# Altium schematic sheet 6.imu.SchDoc
size A4; DocumentNumber: 7; SheetNumber: 7; SheetTotal: 8; Page: IMU
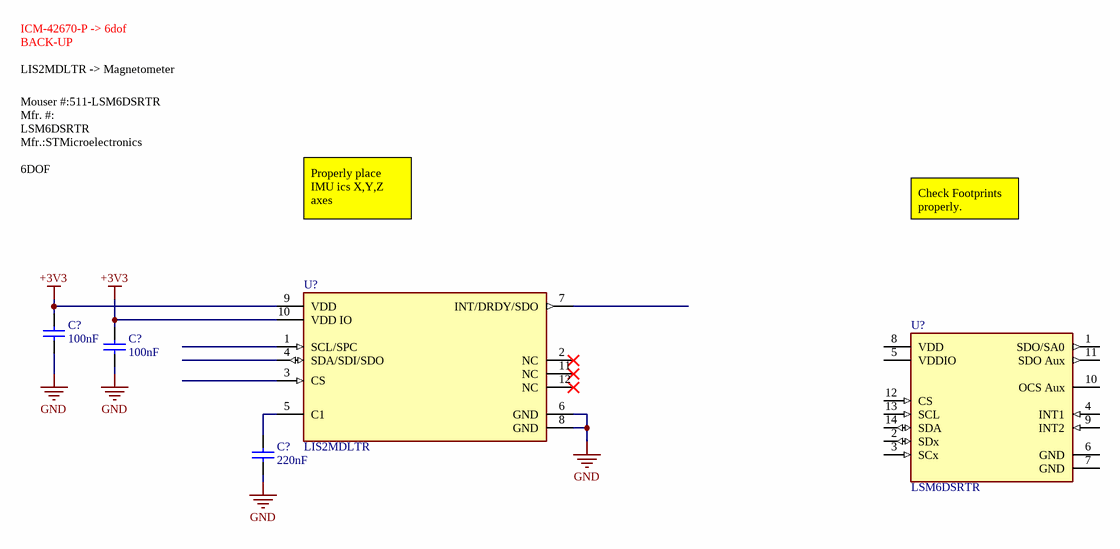
[diagram p0: 6.imu.SchDoc]

## Parts
(Parts that share a designator on the sheet are numbered #1, #2 ... from top to bottom, then left to right.)
C?#1  100nF  [cap0603]
C?#2  100nF  [cap0603]
C?#3  220nF  [cap0603]
U?#1  LIS2MDLTR  [FP-LGA-12-DM00170568-MFG]
U?#2  LSM6DSRTR  [FP-LGA-14L-DM00249496-MFG]

## Nets
+3V3: C?#1.2 C?#2.2 U?#1.9(VDD) U?#1.10(VDD_IO)
GND: C?#1.1 C?#2.1 C?#3.1 U?#1.6(GND) U?#1.8(GND)
NetC?#3_2: C?#3.2 U?#1.5(C1)

Not connected (* = marked no-connect by the designer): U?#1 1(SCL/SPC) 2(NC)* 3(CS) 4(SDA/SDI/SDO) 7(INT/DRDY/SDO) 11(NC)* 12(NC)*; U?#2 1(SDO/SA0) 2(SDx) 3(SCx) 4(INT1) 5(VDDIO) 6(GND) 7(GND) 8(VDD) 9(INT2) 10(OCS_Aux) 11(SDO_Aux) 12(CS) 13(SCL) 14(SDA)

## Notes on the sheet
- LIS2MDLTR -> Magnetometer
- ICM-42670-P -> 6dof
  BACK-UP
- Mouser #:511-LSM6DSRTR
  Mfr. #:
  LSM6DSRTR
  Mfr.:STMicroelectronics
  6DOF
- Properly place IMU ics X,Y,Z axes
- Check Footprints
  properly.
- Title :
- Size:
- Date:
- Page :
- A4
- Number:
- Time:
- Revision:
- Sheet
- of
- Sheet Name :
- Drawn By :

## Library data of the parts
C?#1-C?#3 = Cap: Capacitor; Voltage Rating: 16V; MF: *; MP: *; JLCPCB: *
U?#1 = LIS2MDLTR: SENSOR MR I2C/SPI 12LGA; Manufacturer: STMicroelectronics; Sensing Method: Magnetic; Min Supply Voltage: 1.71V; Sensor Output: I2C,SPI; Operating Supply Current: 50-200uA; Max Supply Voltage: 3.6V; Octopart: https://octopart.com/lis2mdltr-stmicroelectronics-81117311; RoHS: TRUE; Device Class L3: unset; Device Class L1: Sensors; ComponentLink2URL: https://www.st.com/resource/en/datasheet/lis2mdl.pdf; Automotive: No; Device Class L2: Magnetic Sensors; Lead Free: Yes; Temperature: -40°C to +85°C; Manufacturer Part Number: LIS2MDLTR; Temperature Range High: +85°C; Height: 0.7mm; Digikey Description: SENSOR MR I2C/SPI 12LGA; Category: IC; ComponentLink2Description: Datasheet; Package: LGA-12-DM00170568; Temperature Range Low: -40°C
U?#2 = LSM6DSRTR: INEMO INERTIAL MODULE: 3D ACCELE; Manufacturer: STMicroelectronics; Sensor Output: I2C,SPI; Accel Range: 2/4/8/16g; Gyro Range: 125/250/500/1000/2000/4000°/s; Operating Supply Current: 360-1200uA; Max Supply Voltage: 3.6V; Min Supply Voltage: 1.62V; Sensor Type: Temperature,Accelerometer,Gyroscope; Device Class L3: Inertial Measurement Units (IMUs); Package: LGA-14L-DM00249496; ComponentLink2Description: Datasheet; Mouser Description: In a Pack of 2, LSM6DSRTR STMicroelectronics, 3-Axis Accelerometer, Gyroscope, 14-Pin LGA; Footprint Url: https://www.st.com/content/ccc/resource/technical/document/technical_note/73/17/9c/16/dd/96/4a/01/CD00134799.pdf/files/CD00134799.pdf/jcr:content/translations/en.CD00134799.pdf; RoHS: TRUE; Automotive: No; Temperature Range High: +85°C; Digikey Description: INEMO INERTIAL MODULE: 3D ACCELE; Manufacturer Part Number: LSM6DSRTR; ComponentLink2URL: https://www.st.com/resource/en/datasheet/lsm6dsr.pdf; Lead Free: Yes; Category: IC; Temperature Range Low: -40°C; Height: 0.86mm; Octopart: https://octopart.com/lsm6dsrtr-stmicroelectronics-93180177; Temperature: -40°C to +85°C; Device Class L1: Sensors; Device Class L2: Motion Sensors